# Altium schematic sheet Power.SchDoc: Power
size Tabloid; Author: Adam Turaj; SheetNumber: 4; SheetTotal: 6
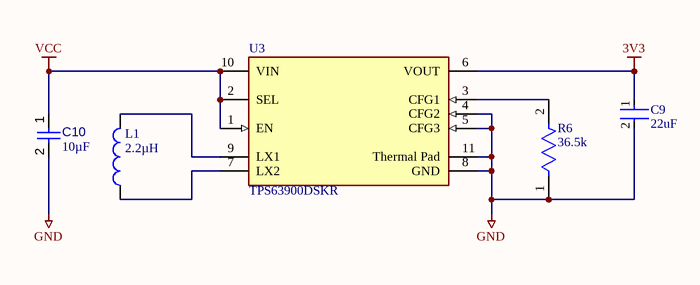
[diagram p0: Power.SchDoc]

## Parts
C9  22uF  [FP-GRM188-0_2-IPC_C]
C10  value 10µF  [CAPC0603(1608)100_L]  (hidden comment: Capacitor 10µF +/-20% 10V 0603)
L1  value 2.2µH  [FP-DFE201210U-MFG]  (hidden comment: DFE201210U-2R2M=P2)
R6  36.5k  [FP-AC0603-IPC_C]
U3  TPS63900DSKR  [FP-DSK0010A-IPC_C]

## Nets
3V3: C9.1 U3.6(VOUT)
GND: C9.2 C10.2 R6.1 U3.4(CFG2) U3.5(CFG3) U3.8(GND) U3.11(Thermal_Pad)
VCC: C10.1 U3.1(EN) U3.2(SEL) U3.10(VIN)
NetL1_1: L1.1 U3.7(LX2)
NetL1_2: L1.2 U3.9(LX1)
NetR6_2: R6.2 U3.3(CFG1)

## Notes on the sheet
- Title:
- Author:
- Size:
- Date:
- Git Hash:
- Tabloid
- Prj:
- Variant:
- Edited:
- File:

## Library data of the parts
C9 = CMP-2000-06337-3: Chip Multilayer Ceramic Capacitors for General Purpose, 0603, 22uF, X5R, 15%, 20%, 10V; Tolerance: 20%; Weight: 0.000222oz; Material: Ceramic; Depth: 0.8mm; Length: 1.6mm; Termination: SMD/SMT; Capacitance: 22uF; Packaging: Tape and Reel; Width: 0.8mm; Voltage Rating: 10V; Case Code (Imperial): 0603; Mount: Surface Mount; Voltage Rating (DC): 10V; Case/Package: 0603; Thickness: 0.039inch; REACH SVHC: No SVHC; Dielectric: X5R; Height: 0.8mm; Package Quantity: 4000; Case Code (Metric): 1608; Min Operating Temperature: -55°C; Lead Free: Lead Free; Max Operating Temperature: 85°C
C10 = CMP-001-00075-4: Chip Capacitor, 10µF +/-20%, 10V, 0603, Thickness 1 mm; Tolerance: 10%; Voltage Rating: 10V; Max Operating Temperature: 85°C; Pins: 2; Case/Package: 0603; Mounting Technology: SMT; Min Operating Temperature: -55°C
L1 = CMP-006-00025-2: Inductor Power Shielded Wirewound 2.2uH 20% 1MHz Metal 1.2A 0.228Ohm DCR 0805 T/R; Self Resonant Frequency: 80MHz; Min Operating Temperature: -40°C; Mounting Technology: Surface Mount; Current Rating: 1.2A; Max Current Rating: 1.2A; Tolerance: 20%; Max Operating Temperature: 125°C; Case/Package: 0805
R6 = CMP-03412-047799-1: RES 36.5KΩ 0.50% 0.1W 0603; RoHS Compliant: Yes
U3 = CMP-04918-000700-1: 1.8-V TO 5.5-V, 75-NA IQ BUCK-BO; RoHS Compliant: Yes